# Altium schematic sheet Safety_Window.SchDoc: 13 - Janela de tensao e supervisao de rails
size A3; Project: CM5 Photonic Bias Controller; DocumentRev: R5; ProjectRev: R5; Version: Rev R6; SheetNumber: 14; SheetTotal: 17; Author: Carlos Renan; SCH_SCALE: N/A; Address1: UFCG; Address2: Referencia: VIRTUS CC; Address3: Campina Grande - PB; ProjectName: Controle automatico de BIAS para MZM/IQ - Projeto 3; DocumentName: Safety_Window.SchDoc
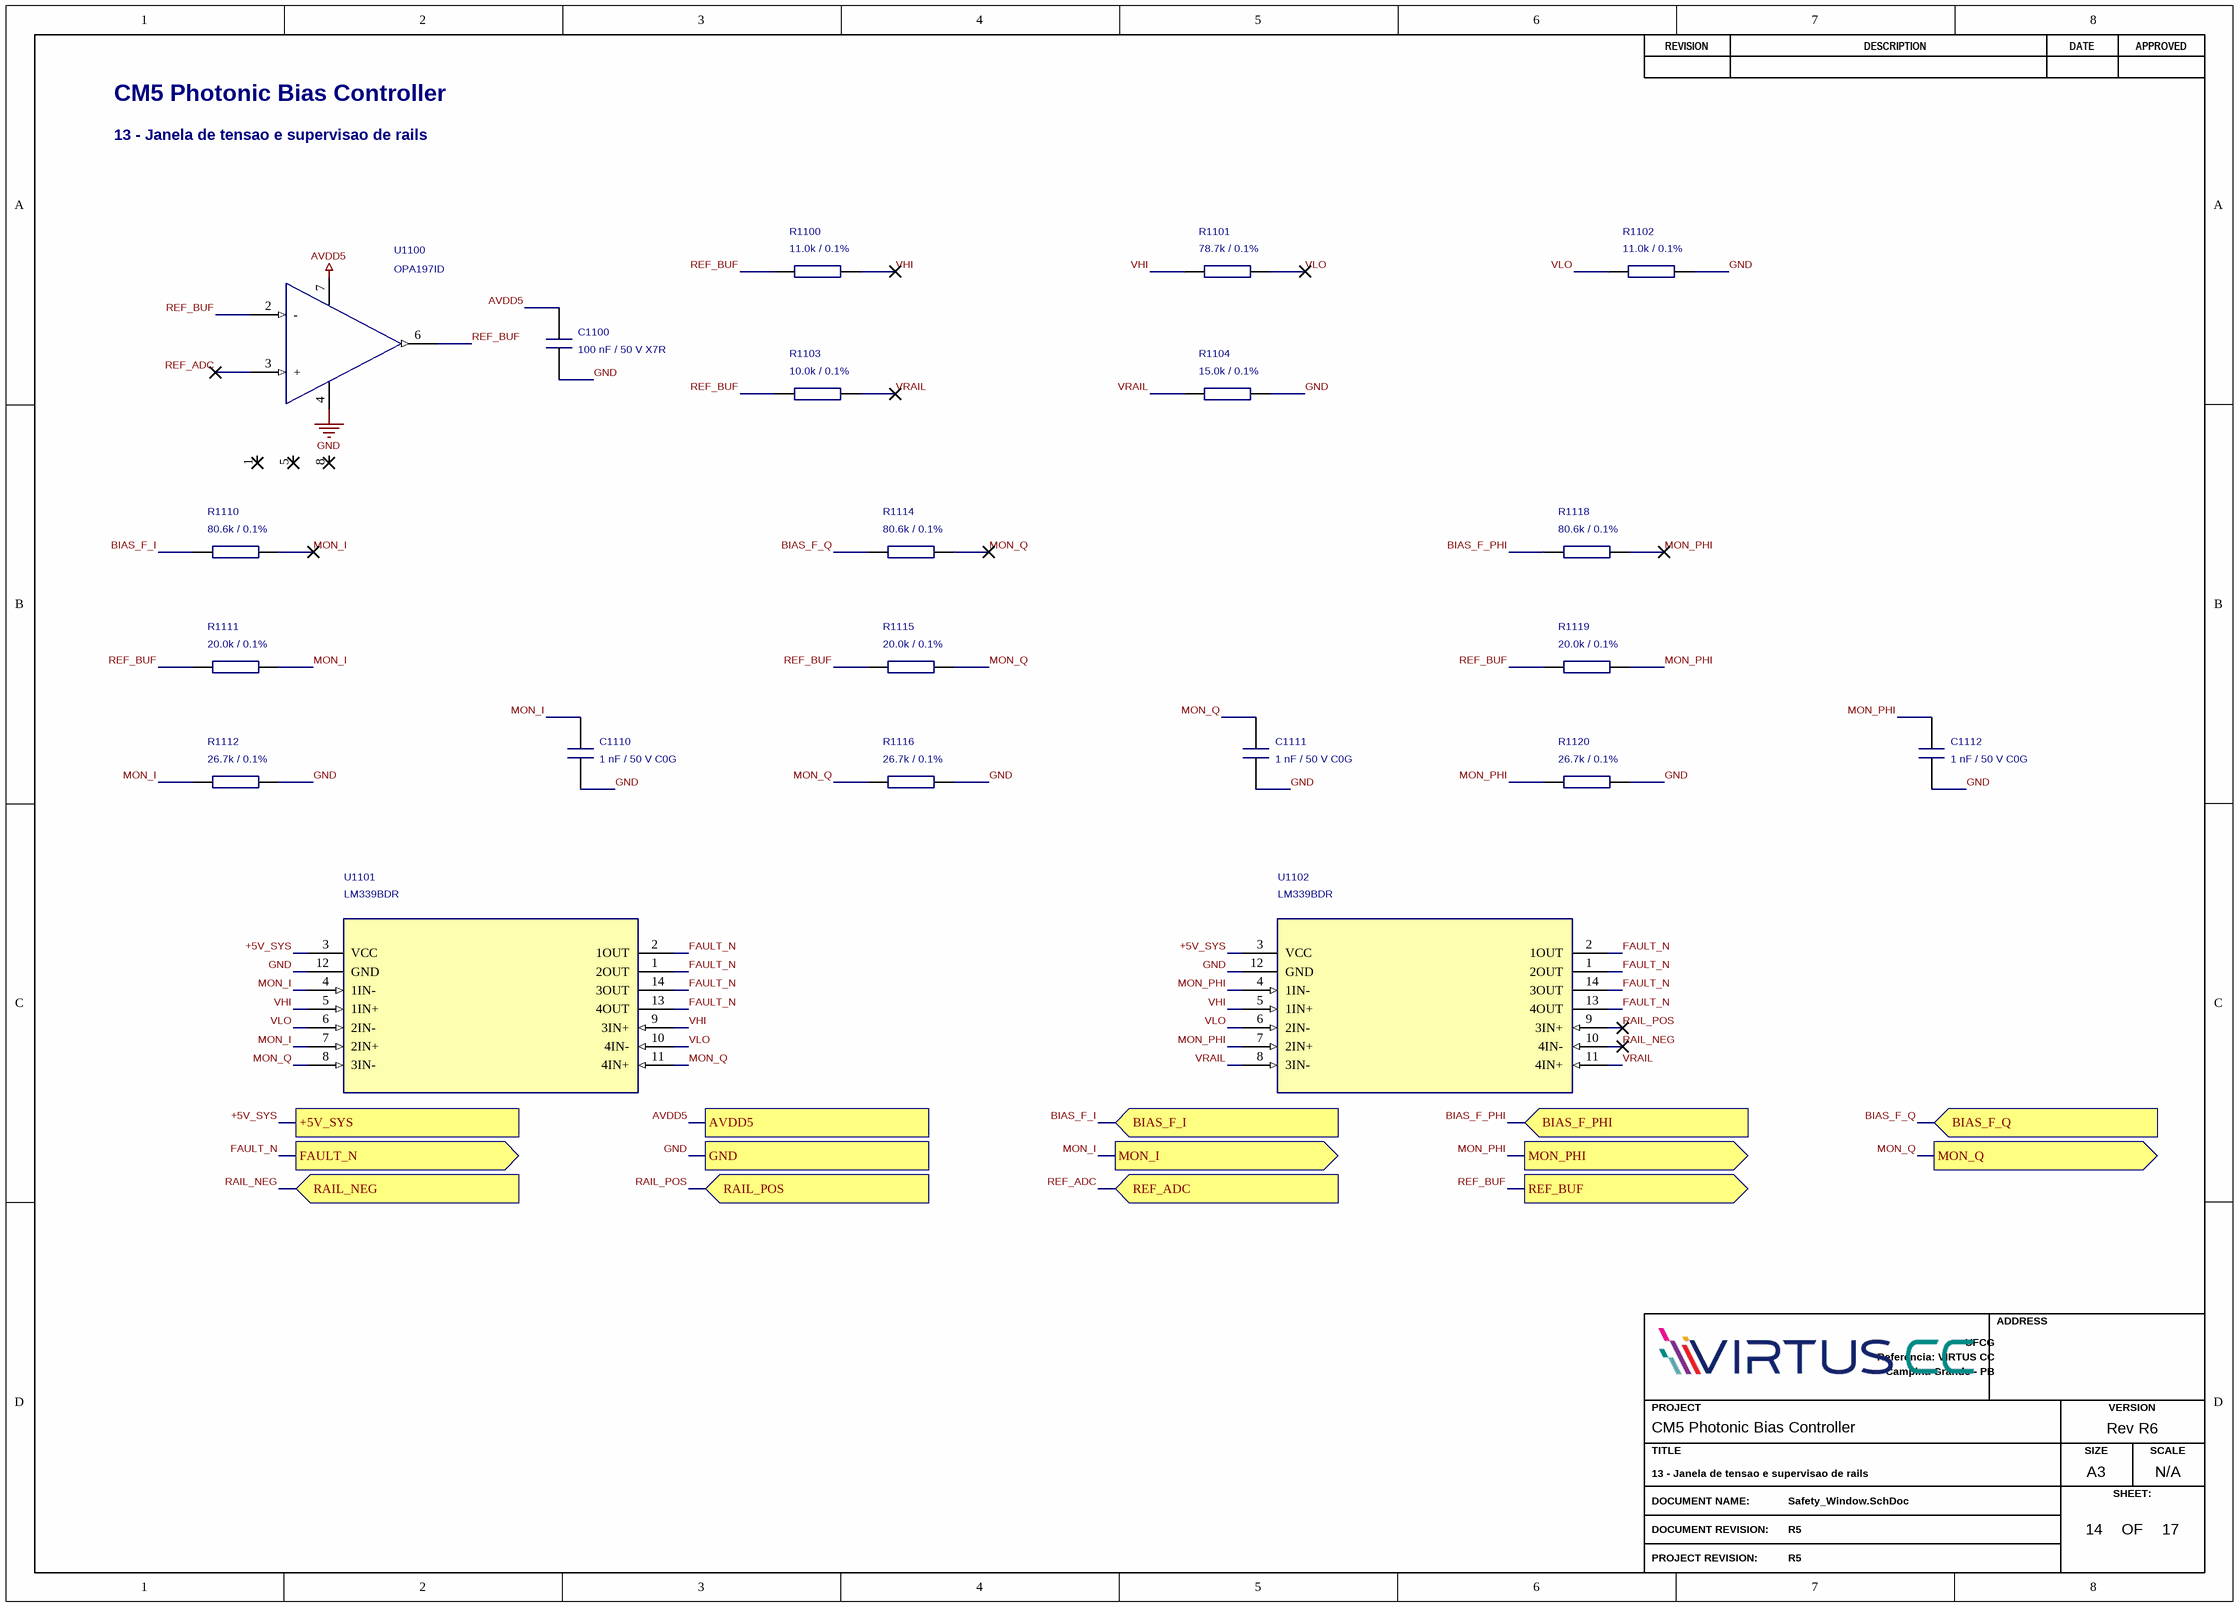
[diagram p0: Safety_Window.SchDoc]

## Parts
C1100  100 nF / 50 V X7R  [C0805]
C1110  1 nF / 50 V C0G  [C0805]
C1111  1 nF / 50 V C0G  [C0805]
C1112  1 nF / 50 V C0G  [C0805]
R1100  11.0k / 0.1%  [R-0603]
R1101  78.7k / 0.1%  [R-0603]
R1102  11.0k / 0.1%  [R-0603]
R1103  10.0k / 0.1%  [R-0603]
R1104  15.0k / 0.1%  [R-0603]
R1110  80.6k / 0.1%  [R-0603]
R1111  20.0k / 0.1%  [R-0603]
R1112  26.7k / 0.1%  [R-0603]
R1114  80.6k / 0.1%  [R-0603]
R1115  20.0k / 0.1%  [R-0603]
R1116  26.7k / 0.1%  [R-0603]
R1118  80.6k / 0.1%  [R-0603]
R1119  20.0k / 0.1%  [R-0603]
R1120  26.7k / 0.1%  [R-0603]
U1100  OPA197ID  [SOIC8]
U1101  LM339BDR  [SOIC14]
U1102  LM339BDR  [SOIC14]

## Ports
+5V_SYS, AVDD5, BIAS_F_I (in), BIAS_F_PHI (in), BIAS_F_Q (in), FAULT_N (out), GND, MON_I (out), MON_PHI (out), MON_Q (out), RAIL_NEG (in), RAIL_POS (in), REF_ADC (in), REF_BUF (out)

## Nets
AVDD5: C1100.1 U1100.7(V+) ; port AVDD5
GND: C1100.2 C1110.2 C1111.2 C1112.2 R1102.2 R1104.2 R1112.2 R1116.2 R1120.2 U1100.4(V-) U1101.12(GND) U1102.12(GND) ; port GND
+5V_SYS: U1101.3(VCC) U1102.3(VCC) ; port +5V_SYS
BIAS_F_I: R1110.1 ; port BIAS_F_I
BIAS_F_PHI: R1118.1 ; port BIAS_F_PHI
BIAS_F_Q: R1114.1 ; port BIAS_F_Q
FAULT_N: U1101.1(2OUT) U1101.2(1OUT) U1101.13(4OUT) U1101.14(3OUT) U1102.1(2OUT) U1102.2(1OUT) U1102.13(4OUT) U1102.14(3OUT) ; port FAULT_N
MON_I: C1110.1 R1110.2 R1111.2 R1112.1 U1101.4(1IN-) U1101.7(2IN+) ; port MON_I
MON_PHI: C1112.1 R1118.2 R1119.2 R1120.1 U1102.4(1IN-) U1102.7(2IN+) ; port MON_PHI
MON_Q: C1111.1 R1114.2 R1115.2 R1116.1 U1101.8(3IN-) U1101.11(4IN+) ; port MON_Q
RAIL_NEG: U1102.10(4IN-) ; port RAIL_NEG
RAIL_POS: U1102.9(3IN+) ; port RAIL_POS
REF_ADC: U1100.3(+) ; port REF_ADC
REF_BUF: R1100.1 R1103.1 R1111.1 R1115.1 R1119.1 U1100.2(-) U1100.6(OUT) ; port REF_BUF
VHI: R1100.2 R1101.1 U1101.5(1IN+) U1101.9(3IN+) U1102.5(1IN+)
VLO: R1101.2 R1102.1 U1101.6(2IN-) U1101.10(4IN-) U1102.6(2IN-)
VRAIL: R1103.2 R1104.1 U1102.8(3IN-) U1102.11(4IN+)

Not connected (* = marked no-connect by the designer): U1100 1(NC)* 5(NC)* 8(NC)*

## Notes on the sheet
- CM5 Photonic Bias Controller
- 13 - Janela de tensao e supervisao de rails
- REVISION
- DESCRIPTION
- DATE
- APPROVED
- ADDRESS
- PROJECT
- VERSION
- TITLE
- A3
- SIZE
- SCALE
- DOCUMENT NAME:
- DOCUMENT REVISION:
- OF
- SHEET:
- PROJECT REVISION:

## Library data of the parts
C1100 = 100 nF: Manufacturer: KEMET; Manufacturer Part Number: C0805C104K5RACTU; Procurement Status: Busca por MPN; SKU e disponibilidade a confirmar; BOM Purchase: Yes; Manufacturer 1: KEMET; Manufacturer Part Number 1: C0805C104K5RACTU; Supplier 1: DigiKey; Supplier URL 1: https://www.digikey.com.br/pt/products/result?keywords=C0805C104K5RACTU; Supplier 2: Mouser; Supplier URL 2: https://br.mouser.com/c/?q=C0805C104K5RACTU; Datasheet: https://www.yageogroup.com/download/specsheet/C0805C104K5RACTU
C1110-C1112 = 1 nF: Manufacturer: KEMET; Manufacturer Part Number: C0805C102J5GACTU; Procurement Status: Busca por MPN; SKU e disponibilidade a confirmar; BOM Purchase: Yes; Manufacturer 1: KEMET; Manufacturer Part Number 1: C0805C102J5GACTU; Supplier 1: DigiKey; Supplier URL 1: https://www.digikey.com.br/pt/products/result?keywords=C0805C102J5GACTU; Supplier 2: Mouser; Supplier URL 2: https://br.mouser.com/c/?q=C0805C102J5GACTU; Datasheet: https://www.yageogroup.com/download/specsheet/C0805C102J5GACTU
R1100 R1102 = 11.0k: Manufacturer: YAGEO; Manufacturer Part Number: RT0603BRD0711KL; Review: Filme fino, 0,1%, 25 ppm/K; 0,1 W. Verificar dissipacao em R210/R212 e matching dos drivers.; Procurement Status: Busca por MPN; SKU e disponibilidade a confirmar; BOM Purchase: Yes; Manufacturer 1: YAGEO; Manufacturer Part Number 1: RT0603BRD0711KL; Supplier 1: DigiKey; Supplier URL 1: https://www.digikey.com.br/pt/products/result?keywords=RT0603BRD0711KL; Supplier 2: Mouser; Supplier URL 2: https://br.mouser.com/c/?q=RT0603BRD0711KL; Datasheet: https://www.yageo.com/en/Product/Index/rchip
R1101 = 78.7k: Manufacturer: YAGEO; Manufacturer Part Number: RT0603BRD0778K7L; Review: Filme fino, 0,1%, 25 ppm/K; 0,1 W. Verificar dissipacao em R210/R212 e matching dos drivers.; Procurement Status: Busca por MPN; SKU e disponibilidade a confirmar; BOM Purchase: Yes; Manufacturer 1: YAGEO; Manufacturer Part Number 1: RT0603BRD0778K7L; Supplier 1: DigiKey; Supplier URL 1: https://www.digikey.com.br/pt/products/result?keywords=RT0603BRD0778K7L; Supplier 2: Mouser; Supplier URL 2: https://br.mouser.com/c/?q=RT0603BRD0778K7L; Datasheet: https://www.yageo.com/en/Product/Index/rchip
R1103 = 10.0k: Manufacturer: YAGEO; Manufacturer Part Number: RT0603BRD0710KL; Review: Filme fino, 0,1%, 25 ppm/K; 0,1 W. Verificar dissipacao em R210/R212 e matching dos drivers.; Procurement Status: Busca por MPN; SKU e disponibilidade a confirmar; BOM Purchase: Yes; Manufacturer 1: YAGEO; Manufacturer Part Number 1: RT0603BRD0710KL; Supplier 1: DigiKey; Supplier URL 1: https://www.digikey.com.br/pt/products/result?keywords=RT0603BRD0710KL; Supplier 2: Mouser; Supplier URL 2: https://br.mouser.com/c/?q=RT0603BRD0710KL; Datasheet: https://www.yageo.com/en/Product/Index/rchip
R1104 = 15.0k: Manufacturer: YAGEO; Manufacturer Part Number: RT0603BRD0715KL; Review: Filme fino, 0,1%, 25 ppm/K; 0,1 W. Verificar dissipacao em R210/R212 e matching dos drivers.; Procurement Status: Busca por MPN; SKU e disponibilidade a confirmar; BOM Purchase: Yes; Manufacturer 1: YAGEO; Manufacturer Part Number 1: RT0603BRD0715KL; Supplier 1: DigiKey; Supplier URL 1: https://www.digikey.com.br/pt/products/result?keywords=RT0603BRD0715KL; Supplier 2: Mouser; Supplier URL 2: https://br.mouser.com/c/?q=RT0603BRD0715KL; Datasheet: https://www.yageo.com/en/Product/Index/rchip
R1110 R1114 R1118 = 80.6k: Manufacturer: YAGEO; Manufacturer Part Number: RT0603BRD0780K6L; Review: Filme fino, 0,1%, 25 ppm/K; 0,1 W. Verificar dissipacao em R210/R212 e matching dos drivers.; Procurement Status: Busca por MPN; SKU e disponibilidade a confirmar; BOM Purchase: Yes; Manufacturer 1: YAGEO; Manufacturer Part Number 1: RT0603BRD0780K6L; Supplier 1: DigiKey; Supplier URL 1: https://www.digikey.com.br/pt/products/result?keywords=RT0603BRD0780K6L; Supplier 2: Mouser; Supplier URL 2: https://br.mouser.com/c/?q=RT0603BRD0780K6L; Datasheet: https://www.yageo.com/en/Product/Index/rchip
R1111 R1115 R1119 = 20.0k: Manufacturer: YAGEO; Manufacturer Part Number: RT0603BRD0720KL; Review: Filme fino, 0,1%, 25 ppm/K; 0,1 W. Verificar dissipacao em R210/R212 e matching dos drivers.; Procurement Status: Busca por MPN; SKU e disponibilidade a confirmar; BOM Purchase: Yes; Manufacturer 1: YAGEO; Manufacturer Part Number 1: RT0603BRD0720KL; Supplier 1: DigiKey; Supplier URL 1: https://www.digikey.com.br/pt/products/result?keywords=RT0603BRD0720KL; Supplier 2: Mouser; Supplier URL 2: https://br.mouser.com/c/?q=RT0603BRD0720KL; Datasheet: https://www.yageo.com/en/Product/Index/rchip
R1112 R1116 R1120 = 26.7k: Manufacturer: YAGEO; Manufacturer Part Number: RT0603BRD0726K7L; Review: Filme fino, 0,1%, 25 ppm/K; 0,1 W. Verificar dissipacao em R210/R212 e matching dos drivers.; Procurement Status: Busca por MPN; SKU e disponibilidade a confirmar; BOM Purchase: Yes; Manufacturer 1: YAGEO; Manufacturer Part Number 1: RT0603BRD0726K7L; Supplier 1: DigiKey; Supplier URL 1: https://www.digikey.com.br/pt/products/result?keywords=RT0603BRD0726K7L; Supplier 2: Mouser; Supplier URL 2: https://br.mouser.com/c/?q=RT0603BRD0726K7L; Datasheet: https://www.yageo.com/en/Product/Index/rchip
U1100 = OPA197ID: Manufacturer: Texas Instruments; Procurement Status: Busca por MPN; SKU e disponibilidade a confirmar; BOM Purchase: Yes; Manufacturer Part Number: OPA197ID; Manufacturer 1: Texas Instruments; Manufacturer Part Number 1: OPA197ID; Supplier 1: DigiKey; Supplier URL 1: https://www.digikey.com.br/pt/products/result?keywords=OPA197ID; Supplier 2: Mouser; Supplier URL 2: https://br.mouser.com/c/?q=OPA197ID; Datasheet: https://www.ti.com/lit/ds/symlink/opa197.pdf
U1101 U1102 = LM339BDR: Manufacturer: Texas Instruments; Procurement Status: Busca por MPN; SKU e disponibilidade a confirmar; BOM Purchase: Yes; Manufacturer Part Number: LM339BDR; Manufacturer 1: Texas Instruments; Manufacturer Part Number 1: LM339BDR; Supplier 1: DigiKey; Supplier URL 1: https://www.digikey.com.br/pt/products/result?keywords=LM339BDR; Supplier 2: Mouser; Supplier URL 2: https://br.mouser.com/c/?q=LM339BDR; Datasheet: https://www.ti.com/lit/ds/symlink/lm339b.pdf